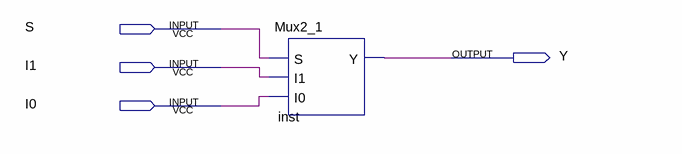
[diagram p0: schematic sheet]
// Quartus schematic MuxDemo.bdf as structural Verilog: 1 symbols, 4 pins
module MuxDemo (
  input  S,
  input  I1,
  input  I0,
  output Y
);

  Mux2_1 inst (.S(S), .I1(I1), .I0(I0), .Y(Y));
endmodule
